# EAGLE design evfcam_mvp (EAGLE 9.6.2)
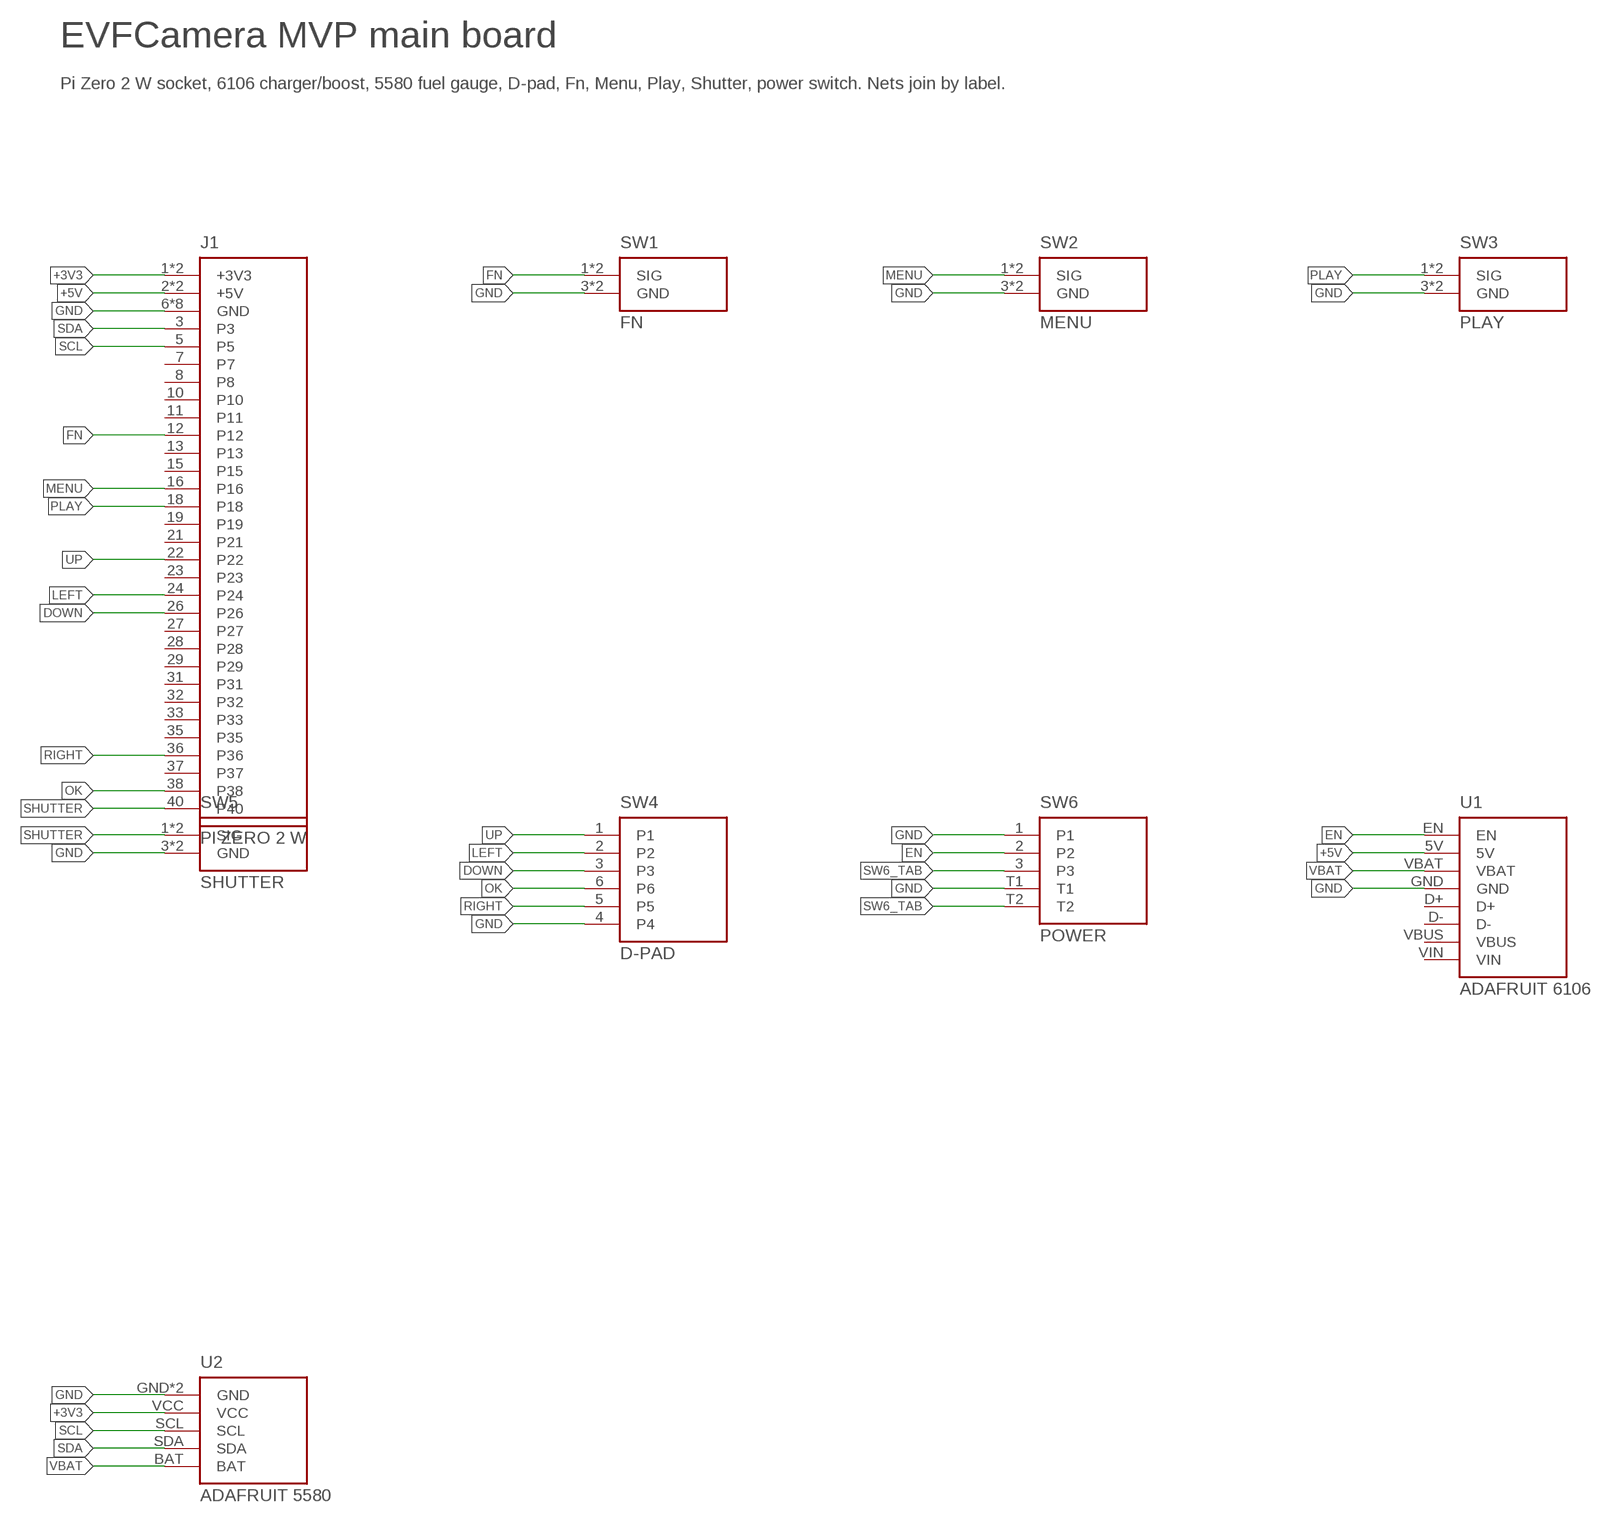
[diagram p0: schematic, sheet 1]

## Parts
J1  PI ZERO 2 W  J1_DEV  [J1_PKG]
SW1  FN  SW1_DEV  [SW1_PKG]
SW2  MENU  SW2_DEV  [SW2_PKG]
SW3  PLAY  SW3_DEV  [SW3_PKG]
SW4  D-PAD  SW4_DEV  [SW4_PKG]
SW5  SHUTTER  SW5_DEV  [SW5_PKG]
SW6  POWER  SW6_DEV  [SW6_PKG]
U1  ADAFRUIT 6106  U1_DEV  [U1_PKG]
U2  ADAFRUIT 5580  U2_DEV  [U2_PKG]

## Nets
+3V3: J1.1(+3V3) J1.17(+3V3) U2.VCC
+5V [power]: J1.2(+5V) J1.4(+5V) U1.5V
DOWN: J1.26 SW4.3
EN: SW6.2 U1.EN
FN: J1.12 SW1.1(SIG) SW1.2(SIG)
GND [power]: J1.6(GND) J1.9(GND) J1.14(GND) J1.20(GND) J1.25(GND) J1.30(GND) J1.34(GND) J1.39(GND) SW1.3(GND) SW1.4(GND) SW2.3(GND) SW2.4(GND) SW3.3(GND) SW3.4(GND) SW4.4 SW5.3(GND) SW5.4(GND) SW6.1 SW6.T1 U1.GND U2.BGND(GND) U2.GND
LEFT: J1.24 SW4.2
MENU: J1.16 SW2.1(SIG) SW2.2(SIG)
OK: J1.38 SW4.6
PLAY: J1.18 SW3.1(SIG) SW3.2(SIG)
RIGHT: J1.36 SW4.5
SCL: J1.5 U2.SCL
SDA: J1.3 U2.SDA
SHUTTER: J1.40 SW5.1(SIG) SW5.2(SIG)
SW6_TAB: SW6.3 SW6.T2
UP: J1.22 SW4.1
VBAT [power]: U1.VBAT U2.BAT
Unconnected: J1.7 J1.8 J1.10 J1.11 J1.13 J1.15 J1.19 J1.21 J1.23 J1.27 J1.28 J1.29 J1.31 J1.32 J1.33 J1.35 J1.37 U1.D+ U1.D- U1.VBUS U1.VIN

## Notes on the sheet
- EVFCamera MVP main board
- Pi Zero 2 W socket, 6106 charger/boost, 5580 fuel gauge, D-pad, Fn, Menu, Play, Shutter, power switch. Nets join by label.

## Library data of the parts
J1 = evfcam_mvp:J1_DEV: 2x20 2.54 mm female socket; the Pi plugs in upside down by its own pins
SW1 = evfcam_mvp:SW1_DEV: Soft tactile button, Adafruit 3101 (left pins = signal, right pins = GND)
SW2 = evfcam_mvp:SW2_DEV: Soft tactile button, Adafruit 3101 (left pins = signal, right pins = GND)
SW3 = evfcam_mvp:SW3_DEV: Soft tactile button, Adafruit 3101 (left pins = signal, right pins = GND)
SW4 = evfcam_mvp:SW4_DEV: 5-way navigation switch, Adafruit 504
SW5 = evfcam_mvp:SW5_DEV: Soft tactile button, Adafruit 3101 (left pins = signal, right pins = GND)
SW6 = evfcam_mvp:SW6_DEV: C&K OS102011MA1QN1 right-angle slide switch. Pin 1 side (up) = OFF
U1 = evfcam_mvp:U1_DEV: BQ25185 charger + 5 V boost breakout, pins through the board
U2 = evfcam_mvp:U2_DEV: MAX17048 fuel gauge breakout; VIN = 3.3 V (its I2C pull-ups go to VIN)

## Net classes
0 default: width 0.8 mm, clearance 0.4 mm
1 power: width 1.2 mm, clearance 0.4 mm

## Board
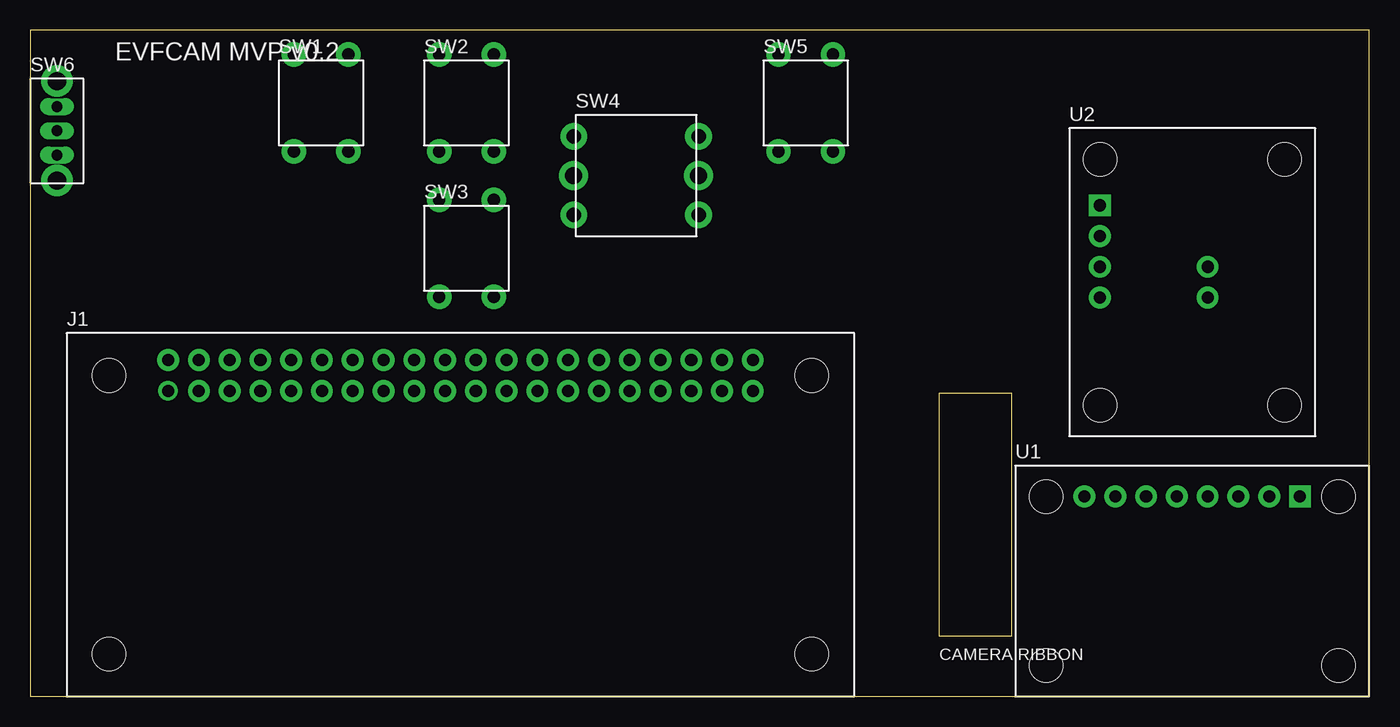
[diagram p1: board, top side]
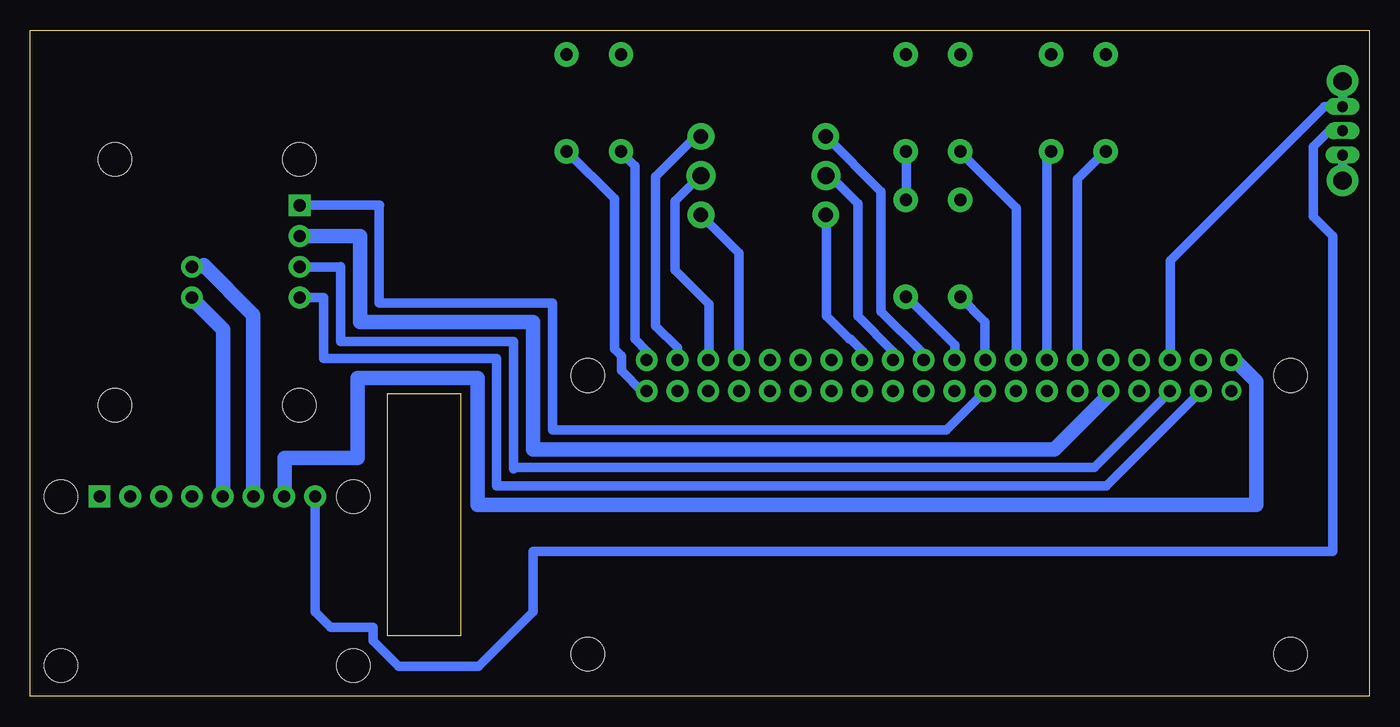
[diagram p2: board, bottom side, seen from below]

Size 110.5 x 55 mm. Coordinates in mm from the lower left corner, seen from the top.
Outline: 0,0 110.5,0 110.5,55 0,55 0,0
Outline: 75,5 81,5 81,25 75,25 75,5
Copper layers (1*16): Top / Bottom
Design rules "evfcam_mill": minimum track width 0.8mm, track to track 0.4mm, track to pad 0.4mm, pad to pad 0.4mm, copper to edge 0.6mm
Holes 2.75 mm at 6.5,3.5 64.5,3.5 6.5,26.5 64.5,26.5 83.83,2.54 107.96,2.54 83.83,16.51 107.96,16.51 88.28,24.04 88.28,44.36 103.52,24.04 103.52,44.36

### Footprints (pad centres in the part's own frame; a part is rotated, then mirrored left to right if it is on the bottom)
J1_PKG = drill 1 pad 1.6 round: 1 -24.13,-1.27 | drill 1 pad 1.8 round: 2 -24.13,1.27; 3 -21.59,-1.27; 4 -21.59,1.27; 5 -19.05,-1.27; 6 -19.05,1.27; 7 -16.51,-1.27; 8 -16.51,1.27; 9 -13.97,-1.27; 10 -13.97,1.27; 11 -11.43,-1.27; 12 -11.43,1.27; 13 -8.89,-1.27; 14 -8.89,1.27; 15 -6.35,-1.27; 16 -6.35,1.27; 17 -3.81,-1.27; 18 -3.81,1.27; 19 -1.27,-1.27; 20 -1.27,1.27; 21 1.27,-1.27; 22 1.27,1.27; 23 3.81,-1.27; 24 3.81,1.27; 25 6.35,-1.27; 26 6.35,1.27; 27 8.89,-1.27; 28 8.89,1.27; 29 11.43,-1.27; 30 11.43,1.27; 31 13.97,-1.27; 32 13.97,1.27; 33 16.51,-1.27; 34 16.51,1.27; 35 19.05,-1.27; 36 19.05,1.27; 37 21.59,-1.27; 38 21.59,1.27; 39 24.13,-1.27; 40 24.13,1.27
SW1_PKG = drill 1 pad 2 round: 1 -2.25,4; 2 -2.25,-4; 3 2.25,4; 4 2.25,-4
SW2_PKG = drill 1 pad 2 round: 1 -2.25,4; 2 -2.25,-4; 3 2.25,4; 4 2.25,-4
SW3_PKG = drill 1 pad 2 round: 1 -2.25,4; 2 -2.25,-4; 3 2.25,4; 4 2.25,-4
SW4_PKG = drill 1.2 pad 2.2 round: 1 -5.15,3.25; 3 -5.15,-3.25; 4 5.15,-3.25; 6 5.15,3.25 | drill 1.4 pad 2.4 round: 2 -5.15,0; 5 5.15,0
SW5_PKG = drill 1 pad 2 round: 1 -2.25,4; 2 -2.25,-4; 3 2.25,4; 4 2.25,-4
SW6_PKG = drill 0.9 pad 1.4 long: 1 0,2; 2 0,0; 3 0,-2 | drill 1.5 pad 2.6 round: T1 0,4.1; T2 0,-4.1
U1_PKG = drill 1 pad 1.8 round: 5V -6.35,0; D+ 1.27,0; D- 3.81,0; EN -8.89,0; GND -1.27,0; VBAT -3.81,0; VBUS 6.35,0 | drill 1 pad 1.8 square: VIN 8.89,0
U2_PKG = drill 1 pad 1.8 round: BAT 4.445,-1.27; BGND 4.445,-3.81; GND -4.445,1.27; SCL -4.445,-1.27; SDA -4.445,-3.81 | drill 1 pad 1.8 square: VCC -4.445,3.81

### Placement (x,y rotation side)
J1  35.5,26.5 0 top
SW1  24,49 0 top
SW2  36,49 0 top
SW3  36,37 0 top
SW4  50,43 0 top
SW5  64,49 0 top
SW6  2.2,46.7 0 top
U1  95.89,16.51 0 top
U2  92.72,36.74 0 top

### Tracks (layer width: path | path; a pad name or v marks a point on that pad's centre or on a via)
+3V3
  Bottom 0.8: 31.7,25.2 34.9,22 67.4,22 67.4,32.5 81.7,32.5 81.7,40.5 | 81.67,40.55 U2.VCC
+5V
  Bottom 1.2: 11.4,27.8 11.1,27.8 9.3,26 9.3,25.2 9.3,15.8 73.6,15.8 73.6,26.3 83.5,26.3 83.5,19.7 89.5,19.7 89.5,16.5
DOWN
  Bottom 0.8: 44.8,39.8 44.8,31.4 42.9,29.5 42.8,29.5 41.8,28.5 41.8,27.8
EN
  Bottom 0.8: U1.EN 87,7 85.7,5.7 82.2,5.7 82.2,4.6 80.1,2.5 78,2.5 73.5,2.5 69,7 69,12 3,12 3,38 4.6,39.6 4.6,45.4 3.3,46.7 SW6.2
FN
  Bottom 0.8: 21.8,45 24.1,42.7 24.1,27.8
GND
  Bottom 0.8: 38.2,33 34.2,29 34.2,27.8 | 38.2,45 38.2,41 | 55.2,39.8 52,36.6 52,27.8 | 66.2,45 62.3,41.1 62.3,28.7 61.7,28.1 61.7,26.9 60,25.2 59.6,25.2 | 16.4,27.8 16.4,36 3.7,48.7 SW6.1 SW6.T1 | 26.2,45 26.6,44.6 26.6,27.8
  Bottom 1.2: 21.5,25.2 21.5,24.9 26,20.4 69,20.4 69,30.9 83.3,30.9 83.3,38 | 97.2,32.9 94.6,30.3 94.6,16.5 | 83.28,38.01 U2.GND
LEFT
  Bottom 0.8: 44.8,43 44.5,43 42.2,40.7 42.2,31.4 39.3,28.5 39.3,27.8
MENU
  Bottom 0.8: 33.8,45 29.1,40.3 29.1,27.8
OK
  Bottom 0.8: 55.2,46.2 55.6,46.2 58.9,42.9 58.9,30.6 57.1,28.8 57.1,27.8
PLAY
  Bottom 0.8: 33.8,33 31.7,30.9 31.7,27.8
RIGHT
  Bottom 0.8: 55.2,43 57.3,40.9 57.3,35.2 54.5,32.4 54.5,27.8
SCL
  Bottom 0.8: 16.4,25.2 22.7,18.9 70.5,18.9 | 70.5,18.9 70.6,18.8 | 70.5,18.9 70.6,19 70.6,29.3 84.9,29.3 84.9,35.5 | 84.88,35.47 U2.SCL
SDA
  Bottom 0.8: 13.9,25.2 21.7,17.4 72,17.4 72,27.9 86.3,27.9 86.3,32.9 | 86.28,32.93 U2.SDA
SHUTTER
  Bottom 0.8: 61.8,45 60.6,43.8 60.6,29.5 59.6,28.5 59.6,27.8
SW6_TAB
  Bottom 0.8: SW6.3 SW6.T2
UP
  Bottom 0.8: 44.8,46.2 40.3,41.7 40.3,31.8 36.8,28.3 36.8,27.8
VBAT
  Bottom 1.2: 92.1,16.5 92.1,31.5 96.2,35.6 96.3,35.5 97.2,35.5

### Text on the board
tPlace: EVFCAM MVP v0.2 | CAMERA RIBBON